# Altium schematic sheet Microcontroller.SchDoc
size A4; SheetNumber: 3; SheetTotal: 4
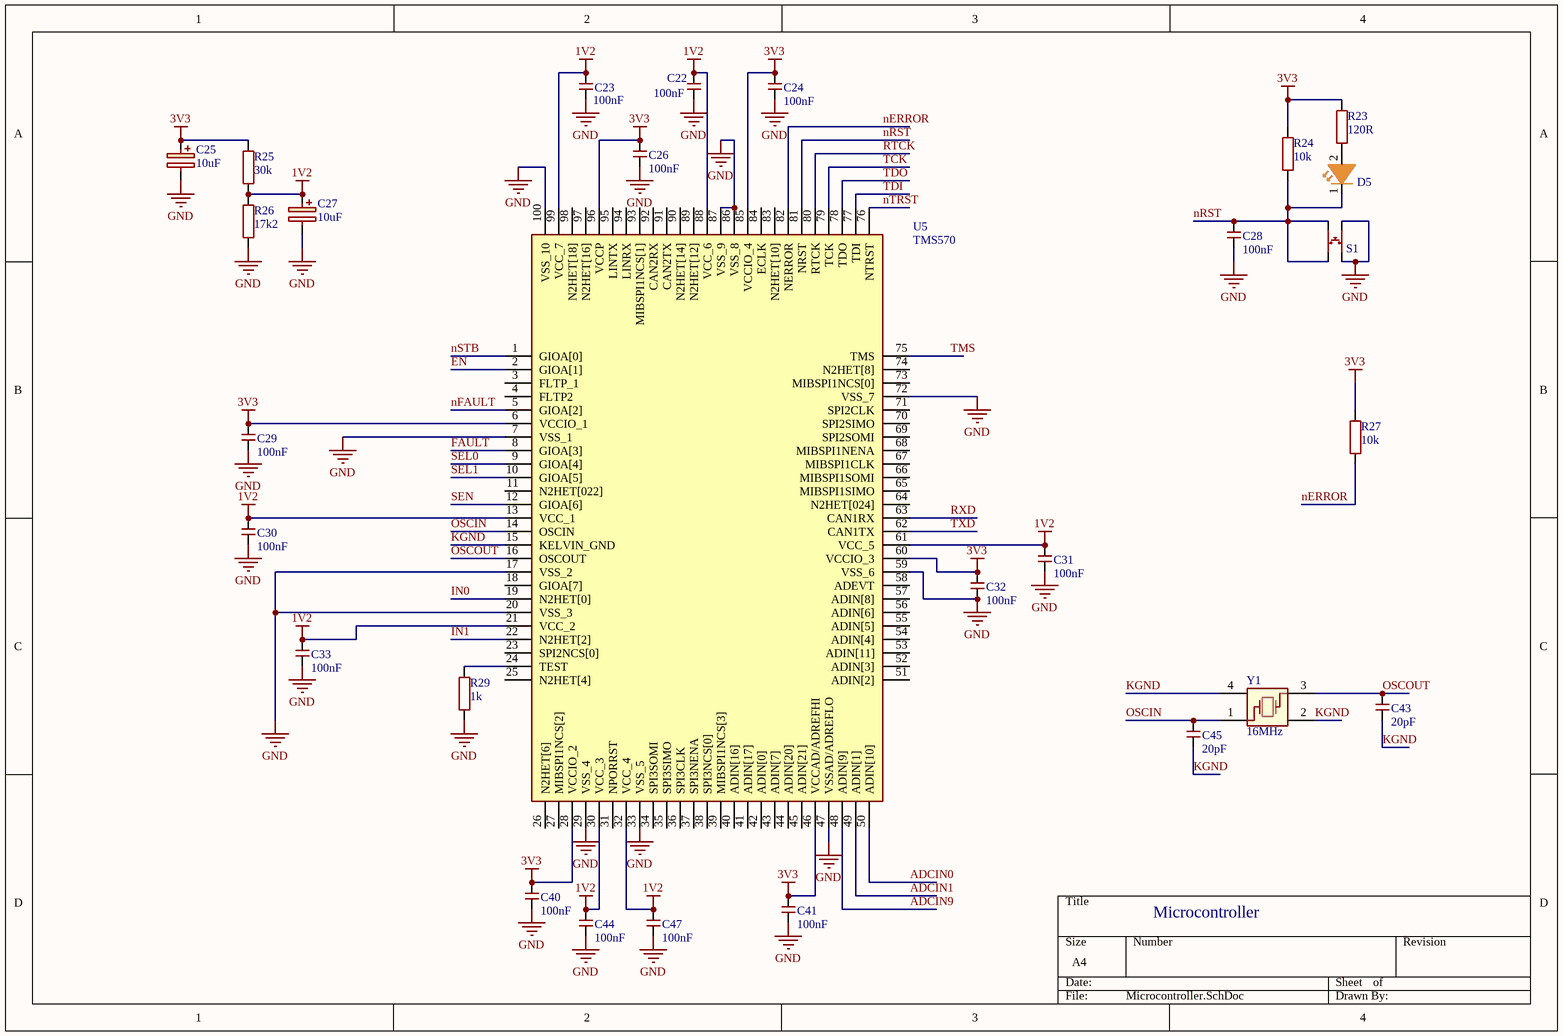
[diagram p0: Microcontroller.SchDoc]

## Parts
C22  100nF  [C0402]
C23  100nF  [C0402]
C24  100nF  [C0402]
C25  10uF  [CAPAE660X565N]
C26  100nF  [C0402]
C27  10uF  [CAPAE660X565N]
C28  100nF  [C0402]
C29  100nF  [C0402]
C30  100nF  [C0402]
C31  100nF  [C0402]
C32  100nF  [C0402]
C33  100nF  [C0402]
C40  100nF  [C0402]
C41  100nF  [C0402]
C43  20pF  [C0402]
C44  100nF  [C0402]
C45  20pF  [C0402]
C47  100nF  [C0402]
D5  150060AS75000  [LED-0603]  (value not drawn)
R23  120R  [R0402]
R24  10k  [R0402]
R25  30k  [R0402]
R26  17k2  [R0402]
R27  10k  [R0402]
R29  1k  [R0402]
S1  Pushbutton  [Pushbutton]  (value not drawn)
U5  TMS570  [QFP50P1600X1600X160-100N]
Y1  16MHz  [ECS1601037B2CTNTR]

## Nets
1V2: C22.2 C23.2 C27.1(+) C30.2 C31.2 C33.2 C44.2 C47.2 R25.1 R26.2 U5.13(VCC_1) U5.21(VCC_2) U5.30(VCC_3) U5.32(VCC_4) U5.61(VCC_5) U5.88(VCC_6) U5.99(VCC_7)
3V3: C24.2 C25.1(+) C26.2 C29.2 C32.2 C40.2 C41.2 R23.2 R24.2 R25.2 R27.2 U5.6(VCCIO_1) U5.28(VCCIO_2) U5.46(VCCAD/ADREFHI) U5.60(VCCIO_3) U5.85(VCCIO_4) U5.96(VCCP)
GND: C22.1 C23.1 C24.1 C25.2 C26.1 C27.2 C28.1 C29.1 C30.1 C31.1 C32.1 C33.1 C40.1 C41.1 C44.1 C47.1 R26.1 R29.1 S1.1 S1.2 U5.7(VSS_1) U5.17(VSS_2) U5.20(VSS_3) U5.29(VSS_4) U5.33(VSS_5) U5.47(VSSAD/ADREFLO) U5.59(VSS_6) U5.72(VSS_7) U5.86(VSS_8) U5.87(VSS_9) U5.100(VSS_10)
ADCIN0: U5.50(ADIN[10])
ADCIN1: U5.49(ADIN[1])
ADCIN9: U5.48(ADIN[9])
EN: U5.2(GIOA[1])
~{FAULT}: U5.8(GIOA[3])
IN0: U5.19(N2HET[0])
IN1: U5.22(N2HET[2])
KGND: C43.1 C45.1 U5.15(KELVIN_GND) Y1.2 Y1.4
nERROR: R27.1 U5.82(NERROR)
nFAULT: U5.5(GIOA[2])
nRST: C28.2 D5.1(K) R24.1 S1.3 S1.4 U5.81(NRST)
nSTB: U5.1(GIOA[0])
nTRST: U5.76(NTRST)
OSCIN: C45.2 U5.14(OSCIN) Y1.1
OSCOUT: C43.2 U5.16(OSCOUT) Y1.3
RTCK: U5.80(RTCK)
RXD: U5.63(CAN1RX)
SEL0: U5.9(GIOA[4])
SEL1: U5.10(GIOA[5])
SEN: U5.12(GIOA[6])
TCK: U5.79(TCK)
TDI: U5.77(TDI)
TDO: U5.78(TDO)
TMS: U5.75(TMS)
TXD: U5.62(CAN1TX)
NetD5_2: D5.2(A) R23.1
NetR29_2: R29.2 U5.24(TEST)

Not connected (* = marked no-connect by the designer): U5 3(FLTP_1) 4(FLTP2) 11(N2HET[022]) 18(GIOA[7]) 23(SPI2NCS[0]) 25(N2HET[4]) 26(N2HET[6]) 27(MIBSPI1NCS[2]) 31(NPORRST) 34(SPI3SOMI) 35(SPI3SIMO) 36(SPI3CLK) 37(SPI3NENA) 38(SPI3NCS[0]) 39(MIBSPI1NCS[3]) 40(ADIN[16]) 41(ADIN[17]) 42(ADIN[0]) 43(ADIN[7]) 44(ADIN[20]) 45(ADIN[21]) 51(ADIN[2]) 52(ADIN[3]) 53(ADIN[11]) 54(ADIN[4]) 55(ADIN[5]) 56(ADIN[6]) 57(ADIN[8]) 58(ADEVT) 64(N2HET[024]) 65(MIBSPI1SIMO) 66(MIBSPI1SOMI) 67(MIBSPI1CLK) 68(MIBSPI1NENA) 69(SPI2SOMI) 70(SPI2SIMO) 71(SPI2CLK) 73(MIBSPI1NCS[0]) 74(N2HET[8]) 83(N2HET[10]) 84(ECLK) 89(N2HET[12]) 90(N2HET[14]) 91(CAN2TX) 92(CAN2RX) 93(MIBSPI1NCS[1]) 94(LINRX) 95(LINTX) 97(N2HET[16]) 98(N2HET[18])

## Notes on the sheet
- Microcontroller

## Library data of the parts
C22-C24 C26 C28-C33 C40 C41 C44 C47 = C0402C104K3PACTU: Ceramic Capacitor, Multilayer, Ceramic, 25V, 10% +Tol, 10% -Tol, X5R, 15% TC, 0.1uF, Surface Mount, 0402; Manufacturer: KEMET; Multilayer: Yes; Supplier: Mouser; Supplier Part Number: 80-C0402C104K3P; Manufacturer Part Number: C0402C104K3PACTU; RoHS: Yes; Category: Ceramic Capacitors; Stock: 262570; Pricing: 1=0.12, 10=0.056, 50=0.056, 100=0.036, 1000=0.026, 10000=0.017 (USD); Mounting Technology: Surface Mount; Pins: 2; Dielectric Material: Ceramic; Package Shape: Rectangular; Case/Package: 0402; Terminal Finish: Nickel; Min Operating Temperature: -55°C; Max Operating Temperature: 85°C; JESD-609 Code: e3; Value: 100nF; Capacitor Type: Ceramic; Tolerance  (fill in as +-): 10%; Packaging: Tape and Reel; Tolerance (fill in as +-): 10%; Rated DC Voltage (URdc): 25V; Temperature Characteristics Code: X5R; Termination: Wraparound; Reach SVHC Compliant: Yes; RoHS Compliant: Yes; ComponentLink1URL: https://datasheet.ciiva.com:443/pdfs/VipMasterIC/IC/KEME/KEME-S-A0008991665/KEME-S-A0008991665-1.pdf?src-supplier=IHS+Markit; ComponentLink1Description: https://datasheet.ciiva.com:443/pdfs/VipMasterIC/IC/KEME/KEME-S-A0008991665/KEME-S-A0008991665-1.pdf?src-supplier=IHS+Markit; ComponentLink2URL: http://www.farnell.com/datasheets/2748284.pdf?src-supplier=Farnell; ComponentLink2Description: http://www.farnell.com/datasheets/2748284.pdf?src-supplier=Farnell; ComponentLink3URL: http://www.farnell.com/datasheets/2748284.pdf?src-supplier=Newark; ComponentLink3Description: http://www.farnell.com/datasheets/2748284.pdf?src-supplier=Newark; ComponentLink4URL: https://datasheet.octopart.com/C0402C104K3PACTU-KEMET-datasheet-181956028.pdf?src-supplier=Element14; ComponentLink4Description: https://datasheet.octopart.com/C0402C104K3PACTU-KEMET-datasheet-181956028.pdf?src-supplier=Element14
C25 C27 = EXV106M050A9GAA: Aluminum Electrolytic Capacitor, Polarized, Aluminum (wet), 50V, 20% +Tol, 20% -Tol, 10uF, Surface Mount, 2626; Manufacturer: KEMET; Dielectric Material: Aluminium; ESR (Equivalent Series Resistance): 2.6R; Leakage Current: 5uA; Ripple Current: 98mA; Tan Delta: 0.12; Supplier: Mouser; Supplier Part Number: 80-EXV106M050A9GAA; Manufacturer Part Number: EXV106M050A9GAA; RoHS: Yes; Category: Aluminum Electrolytic Capacitors; Stock: 17264; Pricing: 1=0.48, 10=0.255, 50=0.255, 100=0.165, 1000=0.139, 10000=0.112 (USD); Mounting Technology: Surface Mount; Pins: 2; Package Shape: Cylindrical; Case/Package: 2626; Min Operating Temperature: -55°C; Max Operating Temperature: 105°C; Polarity: Polarized; Value: 10uF; Capacitor Type: Aluminium; Tolerance  (fill in as +-): 20%; Package Style: SMTMeter; Packaging: Tape and Reel; Tolerance (fill in as +-): 20%; Rated DC Voltage (URdc): 50V; Termination: Flat; Length: 7.8mm; Width: 6.6mm; Height: 5.4mm; Reach SVHC Compliant: Yes; RoHS Compliant: Yes; ComponentLink1URL: https://datasheet.ciiva.com:443/pdfs/VipMasterIC/IC/KEME/KEME-S-A0009591402/KEME-S-A0009591402-1.pdf?src-supplier=IHS+Markit; ComponentLink1Description: https://datasheet.ciiva.com:443/pdfs/VipMasterIC/IC/KEME/KEME-S-A0009591402/KEME-S-A0009591402-1.pdf?src-supplier=IHS+Markit; ComponentLink2URL: https://datasheet.ciiva.com/22698/1500293-22698078.pdf?src-supplier=Element14; ComponentLink2Description: https://datasheet.ciiva.com/22698/1500293-22698078.pdf?src-supplier=Element14
C43 C45 = C0402C200F5GACTU: Ceramic Capacitor, Multilayer, Ceramic, 50V, 1% +Tol, 1% -Tol, C0G, 30ppm/Cel TC, 0.00002uF, Surface Mount, 0402; Manufacturer: KEMET; Multilayer: Yes; Supplier: Mouser; Supplier Part Number: 80-C0402C200F5GACTU; Manufacturer Part Number: C0402C200F5GACTU; RoHS: Yes; Category: Ceramic Capacitors; Stock: 12657; Pricing: 1=1.33, 10=0.87, 50=0.87, 100=0.549, 1000=0.477, 10000=0.408 (USD); Pins: 2; Dielectric Material: Ceramic; Case/Package: 0402; Terminal Finish: Nickel; Min Operating Temperature: -55°C; Max Operating Temperature: 125°C; JESD-609 Code: e3; Value: 20pF; Capacitor Type: Ceramic; Tolerance  (fill in as +-): 1%; Package Style: SMTMeter; Packaging: Tape and Reel; Tolerance (fill in as +-): 1%; Rated DC Voltage (URdc): 50V; Temperature Characteristics Code: C0G; Length: 1mm; Width: 0.5mm; Height: 0.5mm; Reach SVHC Compliant: Yes; RoHS Compliant: Yes; ComponentLink1URL: https://datasheet.ciiva.com:443/pdfs/VipMasterIC/IC/KEME/KEME-S-A0005605168/KEME-S-A0005605168-1.pdf?src-supplier=IHS+Markit; ComponentLink1Description: https://datasheet.ciiva.com:443/pdfs/VipMasterIC/IC/KEME/KEME-S-A0005605168/KEME-S-A0005605168-1.pdf?src-supplier=IHS+Markit; ComponentLink2URL: https://datasheet.octopart.com/C0402C200F5GACTU-KEMET-datasheet-149534727.pdf?src-supplier=Farnell; ComponentLink2Description: https://datasheet.octopart.com/C0402C200F5GACTU-KEMET-datasheet-149534727.pdf?src-supplier=Farnell
D5 = 150060AS75000: Single Color LED, Amber, Water Clear, 1.1mm; Manufacturer: Wurth Electronics; Supplier: Digikey; Supplier Part Number: 732-150060AS75000CT-ND; Manufacturer Part Number: 150060AS75000; RoHS: Yes; Category: LEDs; Stock: 19678; Pricing: 1=0.15, 50=0.142, 100=0.122, 500=0.105 (USD); Optoelectronic Device Type: SINGLE COLOR LED; Reach SVHC Compliant: Yes; RoHS Compliant: Yes; ComponentLink1URL: https://datasheet.ciiva.com:443/pdfs/VipMasterIC/IC/MIDC/MIDC-S-A0007768872/MIDC-S-A0007768872-1.pdf?src-supplier=IHS+Markit; ComponentLink1Description: https://datasheet.ciiva.com:443/pdfs/VipMasterIC/IC/MIDC/MIDC-S-A0007768872/MIDC-S-A0007768872-1.pdf?src-supplier=IHS+Markit; ComponentLink2URL: http://www.farnell.com/datasheets/2621639.pdf?src-supplier=Farnell; ComponentLink2Description: http://www.farnell.com/datasheets/2621639.pdf?src-supplier=Farnell; ComponentLink3URL: http://www.farnell.com/datasheets/2621639.pdf?src-supplier=Element14; ComponentLink3Description: http://www.farnell.com/datasheets/2621639.pdf?src-supplier=Element14; ComponentLink4URL: http://www.farnell.com/datasheets/2621639.pdf?src-supplier=Newark; ComponentLink4Description: http://www.farnell.com/datasheets/2621639.pdf?src-supplier=Newark
R23 = AC0402FR-7D120RL: Fixed Resistor, Metal Glaze/thick Film, 0.0625W, 120ohm, 50V, 1% +/-Tol, -100,100ppm/Cel, 0402; Manufacturer: Yageo; Power: 62.5mW; Package Height: 0.32mm; Package Length: 1mm; Package Width: 0.5mm; Reference Standard: AEC-Q200; Supplier: Mouser; Supplier Part Number: 603-AC0402FR-7D120RL; Manufacturer Part Number: AC0402FR-7D120RL; RoHS: Yes; Category: Chip SMD Resistors; Stock: 13078; Pricing: 1=0.14, 10=0.014, 50=0.014, 100=0.009, 1000=0.008, 10000=0.004 (USD); Pins: 2; Case/Package: 0402; Terminal Finish: Nickel; Min Operating Temperature: -55°C; Max Operating Temperature: 155°C; Tolerance: 1%; JESD-609 Code: e3; Resistor Type: FIXED RESISTOR; Construction: Chip; Packaging: Tape and Reel; Value: 120R; Series: AC; Technology: METAL GLAZE/THICK FILM; Working Voltage: 50V; Temperature Coefficient (ppm/Cel): -100,100; Reach SVHC Compliant: Yes; RoHS Compliant: Yes; ComponentLink1URL: https://datasheet.ciiva.com:443/pdfs/VipMasterIC/IC/YAGO/YAGOS02581/YAGOS02581-1.pdf?src-supplier=IHS+Markit; ComponentLink1Description: https://datasheet.ciiva.com:443/pdfs/VipMasterIC/IC/YAGO/YAGOS02581/YAGOS02581-1.pdf?src-supplier=IHS+Markit
R24 R27 = RP0402BRD0710KL: Resistor, 10K, 0.1%, 0.063W, THIN FILM, 0402;; Manufacturer: Yageo; Supplier: Mouser; Supplier Part Number: 603-RP0402BRD0710KL; Manufacturer Part Number: RP0402BRD0710KL; RoHS: No; Category: Chip SMD Resistors; Stock: 21771; Pricing: 1=0.24, 10=0.171, 50=0.134, 100=0.12, 1000=0.092, 10000=0.074 (USD); ComponentLink1URL: https://datasheet.octopart.com/RP0402BRD0710KL-Yageo-datasheet-179178423.pdf?src-supplier=Newark; ComponentLink1Description: https://datasheet.octopart.com/RP0402BRD0710KL-Yageo-datasheet-179178423.pdf?src-supplier=Newark
R25 = RC0402FR-1330KL: Fixed Resistor, Metal Glaze/thick Film, 0.0625W, 30000ohm, 50V, 1% +/-Tol, 100ppm/Cel, Surface Mount, 0402; Manufacturer: Yageo; Additional Feature: LASER TRIMMABLE; Power: 62.5mW; Rated Temperature: 70°C; Value: 30kR; Temperature Coefficient (ppm/Cel): 100; Package Height: 0.35mm; Package Length: 1mm; Package Width: 0.5mm; Supplier: Mouser; Supplier Part Number: 603-RC0402FR-1330KL; Manufacturer Part Number: RC0402FR-1330KL; RoHS: Yes; Category: Chip SMD Resistors; Stock: 104196; Pricing: 1=0.1, 10=0.01, 50=0.01, 100=0.007, 1000=0.006, 10000=0.003 (USD); Mounting Technology: Surface Mount; Pins: 2; Package Shape: Rectangular; Case/Package: 0402; Terminal Finish: Nickel; Min Operating Temperature: -55°C; Max Operating Temperature: 155°C; Tolerance: 1%; JESD-609 Code: e3; Resistor Type: FIXED RESISTOR; Construction: Chip; Packaging: Tape and Reel; Technology: METAL GLAZE/THICK FILM; Termination: Wraparound; Working Voltage: 50V; Reach SVHC Compliant: Yes; RoHS Compliant: Yes; ComponentLink1URL: https://datasheet.ciiva.com:443/pdfs/VipMasterIC/IC/YAGO/YAGO-S-A0008145938/YAGO-S-A0008145938-1.pdf?src-supplier=IHS+Markit; ComponentLink1Description: https://datasheet.ciiva.com:443/pdfs/VipMasterIC/IC/YAGO/YAGO-S-A0008145938/YAGO-S-A0008145938-1.pdf?src-supplier=IHS+Markit; ComponentLink2URL: https://datasheet.ciiva.com/8889/pyu-rc0402-51-rohs-l-6-8889740.pdf?src-supplier=Avnet; ComponentLink2Description: https://datasheet.ciiva.com/8889/pyu-rc0402-51-rohs-l-6-8889740.pdf?src-supplier=Avnet
R26 = TNPW040217K2BEED: Fixed Resistor, Thin Film, 0.063W, 17200ohm, 50V, 0.1% +/-Tol, 25ppm/Cel, Surface Mount, 0402; Manufacturer: Vishay Dale; Manufacturer Series: TNPW; Power: 63mW; Rated Temperature: 70°C; Value: 17.2kR; Temperature Coefficient (ppm/Cel): 25; Supplier: Mouser; Supplier Part Number: 71-TNPW040217K2BEED; Manufacturer Part Number: TNPW040217K2BEED; RoHS: Yes; Category: Chip SMD Resistors; Stock: 8185; Pricing: 1=0.23, 10=0.192, 50=0.169, 100=0.159, 1000=0.134, 10000=0.113 (USD); Mounting Technology: Surface Mount; Pins: 2; Package Shape: Rectangular; Case/Package: 0402; Terminal Finish: Tin; Min Operating Temperature: -55°C; Max Operating Temperature: 125°C; Tolerance: 0.1%; JESD-609 Code: e3; Resistor Type: FIXED RESISTOR; Packaging: Tape and Reel; Technology: THIN FILM; Termination: Wraparound; Working Voltage: 50V; Reach SVHC Compliant: Yes; RoHS Compliant: Yes; ComponentLink1URL: https://datasheet.ciiva.com:443/pdfs/VipMasterIC/IC/DALE/DALES05753/DALES05753-1.pdf?src-supplier=IHS+Markit; ComponentLink1Description: https://datasheet.ciiva.com:443/pdfs/VipMasterIC/IC/DALE/DALES05753/DALES05753-1.pdf?src-supplier=IHS+Markit; ComponentLink2URL: http://www.vishay.com/docs/28758/tnpw_e3.pdf?src-supplier=Avnet; ComponentLink2Description: http://www.vishay.com/docs/28758/tnpw_e3.pdf?src-supplier=Avnet; ComponentLink3URL: http://www.vishay.com/docs/28758/tnpw_e3.pdf?src-supplier=Digikey; ComponentLink3Description: http://www.vishay.com/docs/28758/tnpw_e3.pdf?src-supplier=Digikey; ComponentLink4URL: http://www.vishay.com/docs/49252/_dbr_smd_resistor_product_overview_vmn_sg2189_1705.pdf?src-supplier=Digikey; ComponentLink4Description: http://www.vishay.com/docs/49252/_dbr_smd_resistor_product_overview_vmn_sg2189_1705.pdf?src-supplier=Digikey
R29 = RT0402FRE101KL: Fixed Resistor, Thin Film, 0.0625W, 1000ohm, 50V, 1% +/-Tol, 50ppm/Cel, Surface Mount, 0402; Manufacturer: Yageo; Supplier: Mouser; Supplier Part Number: 603-RT0402FRE101KL; Manufacturer Part Number: RT0402FRE101KL; RoHS: Yes; Category: Chip SMD Resistors; Stock: 2470; Pricing: 1=0.1, 10=0.026, 50=0.026, 100=0.02, 1000=0.015, 10000=0.01 (USD); Reach SVHC Compliant: Yes; RoHS Compliant: Yes
S1 = Pushbutton: BUTON MINI 6X6X5, 4 PINI; Supplier: Sigmanortec; Price: 0.36 RON
U5 = TMS5700332BPZQQ1: RISC Microcontroller, 32-Bit, FLASH, CORTEX-R4F CPU, 80MHz, CMOS, PQFP100; Manufacturer: Texas Instruments; Supplier: Mouser; Supplier Part Number: 595-TMS5700332BPZQQ1; Manufacturer Part Number: TMS5700332BPZQQ1; RoHS: Yes; Category: Microcontrollers; Stock: 411; Pricing: 1=12.28, 10=9.98, 50=9.52, 100=8.26, 1000=7.2, 10000=6.27 (USD); Terminal Finish: Nickel; JESD-609 Code: e4; Moisture Sensitivity Level: 3; Technology: CMOS; Reach SVHC Compliant: Yes; RoHS Compliant: Yes; ComponentLink1URL: https://www.ti.com:443/lit/ds/symlink/tms570ls0332.pdf?src-supplier=IHS+Markit; ComponentLink1Description: https://www.ti.com:443/lit/ds/symlink/tms570ls0332.pdf?src-supplier=IHS+Markit; ComponentLink2URL: https://www.ti.com/lit/ds/symlink/tms570ls0332.pdf?src-supplier=Digikey; ComponentLink2Description: https://www.ti.com/lit/ds/symlink/tms570ls0332.pdf?src-supplier=Digikey; ComponentLink3URL: http://www.ti.com/lit/gpn/tms570ls0332?src-supplier=Mouser; ComponentLink3Description: http://www.ti.com/lit/gpn/tms570ls0332?src-supplier=Mouser; ComponentLink4URL: http://www.ti.com/general/docs/lit/getliterature.tsp?genericPartNumber=TMS570LS0332&&fileType=pdf&src-supplier=Avnet; ComponentLink4Description: http://www.ti.com/general/docs/lit/getliterature.tsp?genericPartNumber=TMS570LS0332&&fileType=pdf&src-supplier=Avnet
Y1 = ECS-160-10-37B2-CTN-TR: Crystal 16MHz 10pF 4-Pin SMD ECX-1637B2 T/R; Manufacturer: ECS International; Supplier: Mouser; Supplier Part Number: 520-160-10-37B2CTNTR; Manufacturer Part Number: ECS-160-10-37B2-CTN-TR; RoHS: No; Stock: 8732; Pricing: 1=0.28, 10=0.238, 50=0.238, 100=0.232, 1000=0.213, 10000=0.169 (USD); ComponentLink1URL: https://datasheet.octopart.com/ECS-160-10-37B2-CTN-TR-ECS-International-datasheet-163707945.pdf?src-supplier=Master+Electronics; ComponentLink1Description: https://datasheet.octopart.com/ECS-160-10-37B2-CTN-TR-ECS-International-datasheet-163707945.pdf?src-supplier=Master+Electronics